# Altium project stm32f103.PrjPCB
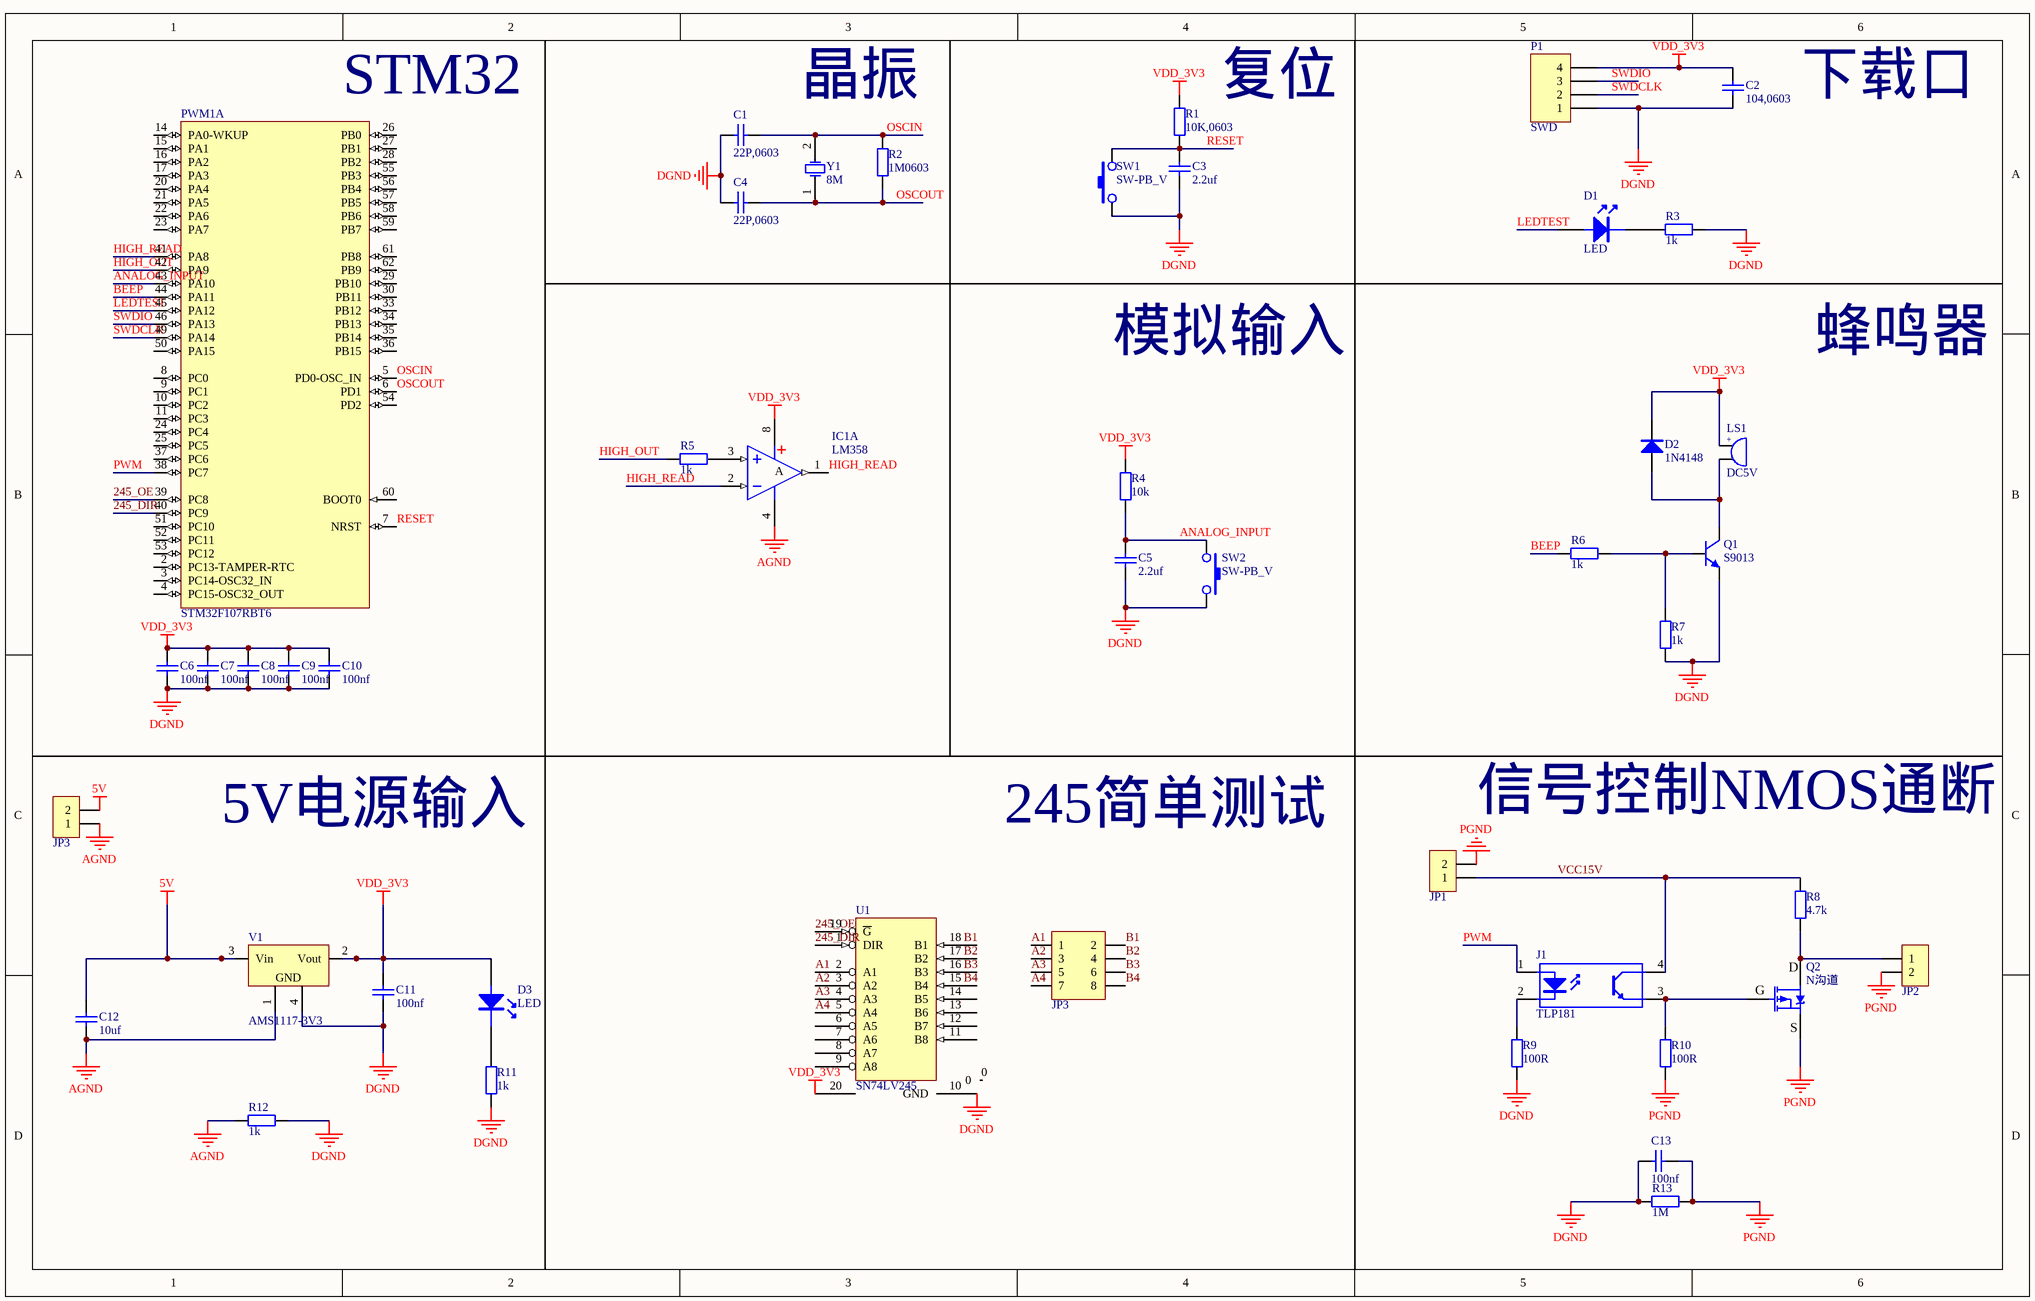
[diagram p0: Sheet1.SchDoc]
1 sheet, 45 parts. Net scope: global (net labels, ports and power ports of the same name join across sheets).
Board file: STM32F103C8T6核心板.PcbDoc

## Sheet Sheet1.SchDoc
size 381 x 241 mm

### Parts
(Parts that share a designator on the sheet are numbered #1, #2 ... from top to bottom, then left to right.)
C1  22P,0603  [C 0603]
C2  104,0603  [C 0603]
C3  2.2uf  [C 0603]
C4  22P,0603  [C 0603]
C5  2.2uf  [C 0603]
C6  100nf  [C 0603]
C7  100nf  [C 0603]
C8  100nf  [C 0603]
C9  100nf  [C 0603]
C10  100nf  [C 0603]
C11  100nf  [C 0603]
C12  10uf  [C 0603]
C13  100nf  [C 0603]
D1  LED  [LED 0805G]
D2  1N4148  [MINI_MELF (LL34)]
D3  LED  [LED 0805G]
IC1  LM358  [SOP8_N]  (part A of 2)
J1  TLP181  [SOP4-W2.54_N]
JP1  HDR-1X2  [XH2.54-WI-2P]  (value not drawn)
JP2  HDR-1X2  [XH2.54-WI-2P]  (value not drawn)
JP3#1  HDR-1X2  [XH2.54-WI-2P]  (value not drawn)
JP3#2  Header 4X2  [IDC2.54-LI-2x4P]  (value not drawn)
LS1  DC5V  [BEEP 5x9x5.5]
P1  SWD  [HDR-1X4_H]
PWM1  STM32F107RBT6  [LQFP64_N]  (part A of 2)
Q1  S9013  [TO92A]
Q2  N沟道  [SOT23-3N]
R1  10K,0603  [R 0603]
R2  1M0603  [R 0603]
R3  1k  [R 0603]
R4  10k  [R 0603]
R5  1k  [R 0603]
R6  1k  [R 0603]
R7  1k  [R 0603]
R8  4.7k  [R 0603]
R9  100R  [R 0603]
R10  100R  [R 0603]
R11  1k  [R 0603]
R12  1k  [R 0603]
R13  1M  [R 0603]
SW1  SW-PB_V  [TSW SMD-3*6*2.5]
SW2  SW-PB_V  [TSW SMD-3*6*2.5]
U1  SN74LV245  [DIP-20]
V1  AMS1117-3V3  [SOT223_L]
Y1  8M  [XTAL-49S DIP]

### Nets
5V: C12.2 JP3#1.2 V1.3(Vin)
AGND: C12.1 IC1.4(V-) JP3#1.1 R12.1 V1.1(GND)
DGND: C1.2 C2.1 C3.1 C4.2 C5.1 C6.1 C7.1 C8.1 C9.1 C10.1 C11.2 C13.2 P1.1 Q1.1(E) R3.2 R7.1 R9.1 R11.2 R12.2 R13.2 SW1.1 SW2.2 U1.10(GND) V1.4(GND)  [also labelled GND]
PGND: C13.1 JP1.2 JP2.2 Q2.3(S) R10.1 R13.1
VCC: C2.2 C6.2 C7.2 C8.2 C9.2 C10.2 C11.1 D2.2(K) D3.1 IC1.8(V+) LS1.1 P1.4 R1.2 R4.2 U1.20(VCC) V1.2(Vout)  [also labelled VDD_3V3]
245_DIR: PWM1.40(PC9) U1.1(DIR)
245_OE: PWM1.39(PC8) U1.19(~{G})
A1: JP3#2.1 U1.2(A1)
A2: JP3#2.3 U1.3(A2)
A3: JP3#2.5 U1.4(A3)
A4: JP3#2.7 U1.5(A4)
ANALOG_INPUT: C5.2 PWM1.43(PA10) R4.1 SW2.1
B1: JP3#2.2
B2: JP3#2.4
B3: JP3#2.6
B4: JP3#2.8
BEEP: PWM1.44(PA11) R6.1
HIGH_OUT: PWM1.42(PA9) R5.1
HIGH_READ: IC1.1(OUT) IC1.2(IN-) PWM1.41(PA8)
LEDTEST: D1.1 PWM1.45(PA12)
OSCIN: C1.1 PWM1.5(PD0-OSC_IN) R2.2 Y1.2(OSC2)
OSCOUT: C4.1 PWM1.6(PD1) R2.1 Y1.1(OSC1)
PWM: J1.1(A) PWM1.38(PC7)
RESET: C3.2 PWM1.7(NRST) R1.1 SW1.2
SWDCLK: P1.2 PWM1.49(PA14)
SWDIO: P1.3 PWM1.46(PA13)
VCC15V: J1.4(C) JP1.1 R8.2
NetD1_2: D1.2 R3.1
NetD2_1: D2.1(A) LS1.2 Q1.3(C)
NetD3_2: D3.2 R11.1
NetIC1_3: IC1.3(IN+) R5.2
NetJ1_2: J1.2(K) R9.2
NetJ1_3: J1.3(E) Q2.1(G) R10.2
NetJP2_1: JP2.1 Q2.2(D) R8.1
NetQ1_2: Q1.2(B) R6.2 R7.2

Not connected (* = marked no-connect by the designer): PWM1 2(PC13-TAMPER-RTC) 3(PC14-OSC32_IN) 4(PC15-OSC32_OUT) 8(PC0) 9(PC1) 10(PC2) 11(PC3) 14(PA0-WKUP) 15(PA1) 16(PA2) 17(PA3) 20(PA4) 21(PA5) 22(PA6) 23(PA7) 24(PC4) 25(PC5) 26(PB0) 27(PB1) 28(PB2) 29(PB10) 30(PB11) 33(PB12) 34(PB13) 35(PB14) 36(PB15) 37(PC6) 50(PA15) 51(PC10) 52(PC11) 53(PC12) 54(PD2) 55(PB3) 56(PB4) 57(PB5) 58(PB6) 59(PB7) 60(BOOT0) 61(PB8) 62(PB9); U1 0 6(A5) 7(A6) 8(A7) 9(A8) 11(B8) 12(B7) 13(B6) 14(B5) 15(B4) 16(B3) 17(B2) 18(B1)

### Notes on the sheet
- (near PWM1) STM32
- 晶振
- (near R1) 复位
- 下载口
- 模拟输入
- 蜂鸣器
- 5V电源输入
- 245简单测试
- (near JP1) 信号控制NMOS通断
- Labels drawn without touching a wire or pin: B1, B2, B3, B4
- (in symbol BEEP) +
- (in symbol LM358, part A) A

### Library data of the parts
C1-C13 = Cap: Capacitor; Value: 104; Published: 8-Jun-2000; LatestRevisionDate: 17-Jul-2002; LatestRevisionNote: Re-released for DXP Platform.; Publisher: Altium Limited
D2 = 1N4148: 开关二极管; BOM名称: 高速开关二极管; 联系卖家，免费查找封装: 唯一出售店铺网址https://shop463601444.taobao.com
IC1 = LM358: 双路运放; 联系卖家，免费查找封装: 唯一出售店铺网址https://shop463601444.taobao.com; BOM名称: 双路运放
J1 = TLP521-1: 1路开关光耦; 封装库来自 淘宝卖家 ID：黄晶宝石: 其他店铺购入均为盗版假冒封装库，请立即申请退款; BOM名称: 1路开关光耦
JP1 JP2 JP3#1 = Header 2: 2P接插件; 封装库来自淘宝卖家 ID：黄晶宝石: 其他店铺购入均为盗版假冒封装库; 联系卖家，免费查找封装: 唯一出售店铺网址https://shop463601444.taobao.com; BOM名称: 2P接插件
JP3#2 = Header 4X2: 4*2P接插件; 封装库来自淘宝卖家 ID：黄晶宝石: 其他店铺购入均为盗版假冒封装库; 联系卖家，免费查找封装: 唯一出售店铺网址https://shop463601444.taobao.com; BOM名称: 4*2P接插件
LS1 = BEEP: 蜂鸣器; 联系卖家，免费查找封装: 唯一出售店铺网址https://shop463601444.taobao.com; BOM名称: 蜂鸣器
P1 = Header 4: Header, 4-Pin; LatestRevisionDate: 17-Jul-2002; LatestRevisionNote: Re-released for DXP Platform.; Publisher: Altium Limited
PWM1 = STM32F107RBT6: STM32 ARM-based 32-bit MCU Connectivity Line & Ethernet with 128 kB Flash, 48 kB Internal RAM, -40 to +85癈 Temperature, 64-Pin LQFP, Tray; 联系卖家，免费查找封装: 唯一出售店铺网址https://shop463601444.taobao.com; DatasheetVersion: rev5.0, May-2010; PackageVersion: rev13, Apr-2011; PackageReference: LQFP64; PackageDescription: 64-Pin Low-Profile Quad Flat Pack, 10 x 10 mm Body, 0.5 mm Pitch (LQFP64); ComponentLink1Description: Manufacturer URL; ComponentLink1URL: http://www.st.com/; ComponentLink2Description: STM32F105/107 Datasheet; ComponentLink2URL: http://www.st.com/internet/com/TECHNICAL_RESOURCES/TECHNICAL_LITERATURE/DATASHEET/CD00220364.pdf; ComponentLink3Description: STM32 Family Web Page; ComponentLink3URL: www.st.com/stm32
Q1 = 9013-DIP: 低频放大-NPN型; 联系卖家，免费查找封装: 唯一出售店铺网址https://shop463601444.taobao.com; 封装库来自淘宝卖家 ID：黄晶宝石: 其他店铺购入均为假冒封装库; 参数: 50V 0.5A 0.625W; BOM名称: 低频放大-NPN型
Q2 = SI2301: P沟道 20V/2.8A; BOM名称: P沟道场效应管; 联系卖家，免费查找封装: 唯一出售店铺网址https://shop463601444.taobao.com; 封装库来自淘宝卖家 ID：黄晶宝石: 其他店铺购入均为假冒封装库
R1-R13 = Res2: Resistor; Published: 8-Jun-2000; LatestRevisionDate: 17-Jul-2002; LatestRevisionNote: Re-released for DXP Platform.; Publisher: Altium Limited
SW1 SW2 = SW-PB_V: SWITCH
U1 = SN74LS642: OCTAL BUS TRANCEIVER; 技术支持，联系售后: 唯一出售店铺网址https://shop463601444.taobao.com
V1 = AMS1117: 三端稳压芯片; BOM名称: 稳压芯片; 封装库来自淘宝卖家 ID：黄晶宝石: 其他店铺购入均为假冒，请立即申请退款，本店奖励5~10元现金; 联系卖家 免费查找封装: 唯一出售店铺网址https://shop463601444.taobao.com
Y1 = XTAL: Crystal Oscillator; Published: 8-Jun-2000; LatestRevisionDate: 17-Jul-2002; LatestRevisionNote: Re-released for DXP Platform.; Publisher: Altium Limited